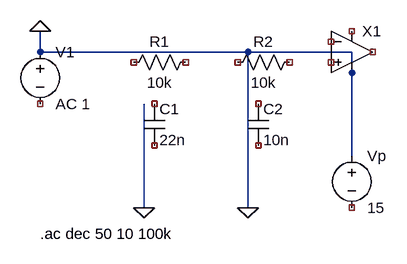
[diagram p0: schematic Ex12.asc]
Ex12.asc, the LTspice schematic file:
Version 4
SHEET 1 1920 1080
WIRE 80 160 80 128
WIRE 240 160 80 160
WIRE 400 160 240 160
WIRE 560 160 400 160
WIRE 400 240 400 160
WIRE 560 240 560 160
WIRE 240 320 240 240
WIRE 400 320 400 240
WIRE 560 320 560 240
WIRE 240 400 240 320
WIRE 400 400 400 320
FLAG 80 128 0
FLAG 240 400 0
FLAG 400 400 0
SYMBOL voltage 80 144 R0
WINDOW 123 24 44 Left 2
WINDOW 39 0 0 Left 0
SYMATTR InstName V1
SYMATTR Value AC 1
SYMBOL res 320 160 R90
WINDOW 0 0 56 VBottom 2
WINDOW 3 32 56 VTop 2
SYMATTR InstName R1
SYMATTR Value 10k
SYMBOL res 480 160 R90
WINDOW 0 0 56 VBottom 2
WINDOW 3 32 56 VTop 2
SYMATTR InstName R2
SYMATTR Value 10k
SYMBOL cap 240 240 R0
SYMATTR InstName C1
SYMATTR Value 22n
SYMBOL cap 400 240 R0
SYMATTR InstName C2
SYMATTR Value 10n
SYMBOL Opamps\UniversalOpAmp2 560 160 R0
SYMATTR InstName X1
SYMBOL voltage 560 304 R0
WINDOW 123 0 0 Left 0
WINDOW 39 0 0 Left 0
SYMATTR InstName Vp
SYMATTR Value 15
NET 80 160 in
NET 240 160 a
NET 400 160 p
NET 560 160 out
TEXT 80 440 Left 2 !.ac dec 50 10 100k

The netlist it stands for:
* Ex12.asc
V1 0 NC_01 AC 1
R1 NC_02 NC_03 10k
R2 NC_04 NC_05 10k
C1 NC_06 NC_07 22n
C2 NC_08 NC_09 10n
XX1 NC_10 NC_11 NC_12 0 NC_13 level2 Avol=1Meg GBW=10Meg Slew=10Meg Ilimit=25m Rail=0 Vos=0 En=0 Enk=0 In=0 Ink=0 Rin=500Meg  ; pins In+ In- V+ V- OUT
Vp 0 NC_14 15
.ac dec 50 10 100k
.lib UniversalOpAmp2.lib
.backanno
.end